# Altium schematic sheet Top_Sheet.SchDoc
size 420 x 297 mm; SheetNumber: 1; SheetTotal: 4
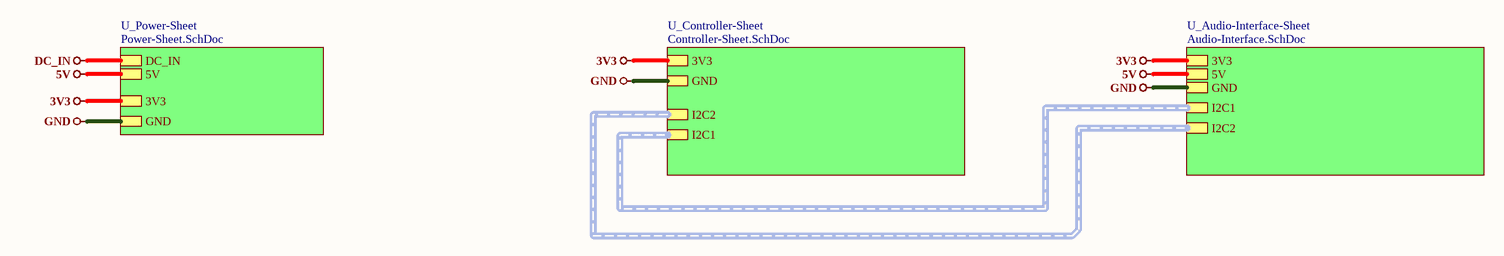
[diagram p0: Top_Sheet.SchDoc]

## Sub-sheets
U_Audio-Interface-Sheet = Audio-Interface.SchDoc: I2C1 (harness I2C), 3V3, GND, 5V, I2C2 (harness I2C)
U_Controller-Sheet = Controller-Sheet.SchDoc: 3V3, GND, I2C1 (harness I2C), I2C2 (harness I2C)
U_Power-Sheet = Power-Sheet.SchDoc: 3V3, 5V, GND, DC_IN

## Nets
3V3: sheet U_Controller-Sheet/3V3, sheet U_Power-Sheet/3V3, sheet U_Audio-Interface-Sheet/3V3
5V: sheet U_Power-Sheet/5V, sheet U_Audio-Interface-Sheet/5V
DC_IN: sheet U_Power-Sheet/DC_IN
GND: sheet U_Controller-Sheet/GND, sheet U_Power-Sheet/GND, sheet U_Audio-Interface-Sheet/GND

## Buses and harness runs
harness sheet U_Audio-Interface-Sheet/I2C1 = sheet U_Controller-Sheet/I2C1
harness sheet U_Audio-Interface-Sheet/I2C2 = sheet U_Controller-Sheet/I2C2

## Notes on the sheet
- File:
- Title:
- Date:
- Page
- Num:
- Total:
- Drawn By: Huzaifa Ali